# Altium schematic sheet 30_TIME_GNSS.SchDoc
size 594 x 420 mm
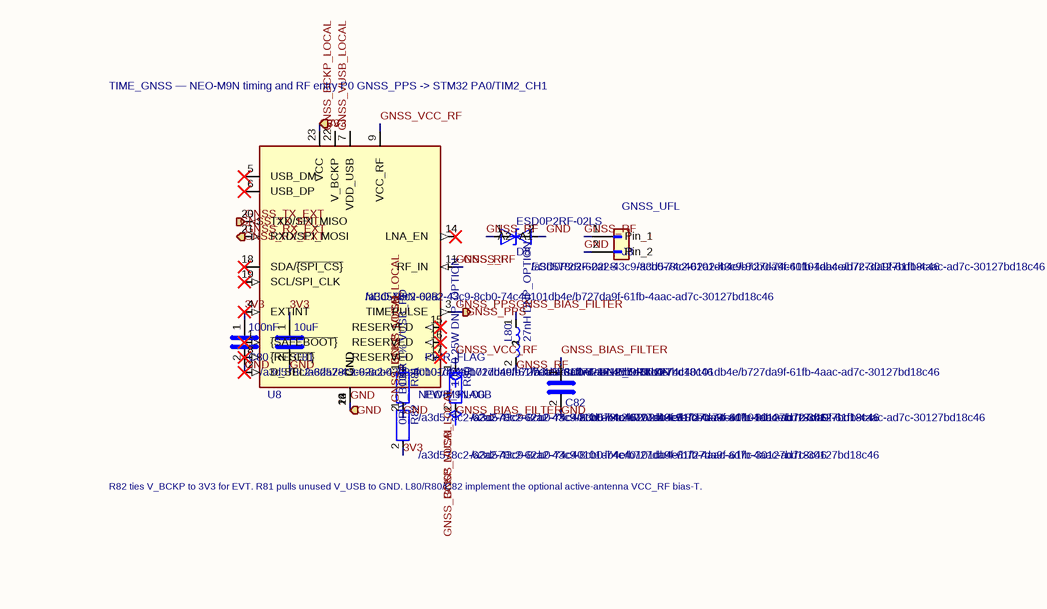
[diagram p0: 30_TIME_GNSS.SchDoc, top]
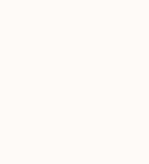
[diagram p1: 30_TIME_GNSS.SchDoc, bottom]

## Parts
#FLG0301  hierarchy_path: /a3d578c2-62a2-43c9-8cb0-74c40101db4e/b727da9f-61fb-4aac-ad7c-30127bd18c46  (hidden comment: PWR_FLAG)  (graphical)
#FLG0302  hierarchy_path: /a3d578c2-62a2-43c9-8cb0-74c40101db4e/b727da9f-61fb-4aac-ad7c-30127bd18c46  (hidden comment: PWR_FLAG)  (graphical)
C80  hierarchy_path: /a3d578c2-62a2-43c9-8cb0-74c40101db4e/b727da9f-61fb-4aac-ad7c-30127bd18c46  [C_0402_1005Metric]  (hidden comment: 100nF)
C81  hierarchy_path: /a3d578c2-62a2-43c9-8cb0-74c40101db4e/b727da9f-61fb-4aac-ad7c-30127bd18c46  [C_0805_2012Metric]  (hidden comment: 10uF)
C82  hierarchy_path: /a3d578c2-62a2-43c9-8cb0-74c40101db4e/b727da9f-61fb-4aac-ad7c-30127bd18c46  [C_0402_1005Metric]  (hidden comment: 100nF DNP_OPTION)
D8  hierarchy_path: /a3d578c2-62a2-43c9-8cb0-74c40101db4e/b727da9f-61fb-4aac-ad7c-30127bd18c46  [ESD0P2RF-02LS_PG-TSSLP-2-1]  (hidden comment: ESD0P2RF-02LS)
J8  hierarchy_path: /a3d578c2-62a2-43c9-8cb0-74c40101db4e/b727da9f-61fb-4aac-ad7c-30127bd18c46  [Hirose_UFL_R_SMT_K]  (hidden comment: GNSS_UFL)
L80  hierarchy_path: /a3d578c2-62a2-43c9-8cb0-74c40101db4e/b727da9f-61fb-4aac-ad7c-30127bd18c46  [L_0402_1005Metric]  (hidden comment: 27nH DNP_OPTION)
R80  hierarchy_path: /a3d578c2-62a2-43c9-8cb0-74c40101db4e/b727da9f-61fb-4aac-ad7c-30127bd18c46  [R_0805_2012Metric]  (hidden comment: 10R 0.25W DNP_OPTION)
R81  hierarchy_path: /a3d578c2-62a2-43c9-8cb0-74c40101db4e/b727da9f-61fb-4aac-ad7c-30127bd18c46  [R_0603_1608Metric]  (hidden comment: 100k 1% VUSB_PD)
R82  hierarchy_path: /a3d578c2-62a2-43c9-8cb0-74c40101db4e/b727da9f-61fb-4aac-ad7c-30127bd18c46  [R_0603_1608Metric]  (hidden comment: 0R V_BCKP)
U8  hierarchy_path: /a3d578c2-62a2-43c9-8cb0-74c40101db4e/b727da9f-61fb-4aac-ad7c-30127bd18c46  [NEO-M9N_LCC24_12.2x16mm]  (hidden comment: NEO-M9N-00B)

## Ports
3V3 (in), GND, GNSS_PPS (out), GNSS_RX_EXT (in), GNSS_TX_EXT (out)

## Nets
3V3: C80.1 C81.1 R82.2 U8.4(EXTINT) U8.23(VCC) ; port 3V3
GND: C80.2 C81.2 C82.2 D8.2(A2) J8.2(Pin_2) R81.2 U8.2(D_SEL) U8.10(GND) U8.12(GND) U8.13(GND) U8.24(GND) ; port GND
GNSS_BCKP_LOCAL: #FLG0301.1 R82.1 U8.22(V_BCKP)
GNSS_BIAS_FILTER: C82.1 L80.1 R80.2
GNSS_PPS: U8.3(TIMEPULSE) ; port GNSS_PPS
GNSS_RF: D8.1(A1) J8.1(Pin_1) L80.2 U8.11(RF_IN)
GNSS_RX_EXT: U8.21(RXD/SPI_MOSI) ; port GNSS_RX_EXT
GNSS_TX_EXT: U8.20(TXD/SPI_MISO) ; port GNSS_TX_EXT
GNSS_VCC_RF: R80.1 U8.9(VCC_RF)
GNSS_VUSB_LOCAL: #FLG0302.1 R81.1 U8.7(VDD_USB)

Not connected (* = marked no-connect by the designer): U8 1(~{{SAFEBOOT}})* 5(USB_DM)* 6(USB_DP)* 8(~{{RESET}})* 14(LNA_EN)* 15(RESERVED)* 16(RESERVED)* 17(RESERVED)* 18(SDA/~{{SPI_CS}})* 19(SCL/SPI_CLK)*

## Notes on the sheet
- (near U8) TIME_GNSS — NEO-M9N timing and RF entry
  P0 GNSS_PPS -> STM32 PA0/TIM2_CH1
- R82 ties V_BCKP to 3V3 for EVT. R81 pulls unused V_USB to GND.
  L80/R80/C82 implement the optional active-antenna VCC_RF bias-T.
- 1
- 2
- 3
- 4
- 5
- 6
- 7
- 8
- 9
- 10
- 11
- A
- B
- C
- D
- E
- F
- G
- H
- Title: EVT_SYS_CARRIER
- File: 30_TIME_GNSS.kicad_sch
- Sheet: /
- KiCad E.D.A.  kicad (5.1.4)-1
- Size: A2
- Date:
- Rev:
- Id: 1/1

## Library data of the parts
C80-C82 = C
  C80: Value: 100nF; Footprint: Capacitor_SMD:C_0402_1005Metric
  C81: Value: 10uF; Footprint: Capacitor_SMD:C_0805_2012Metric
  C82: Value: 100nF DNP_OPTION; Footprint: Capacitor_SMD:C_0402_1005Metric
D8 = D_TVS: MPN: ESD0P2RF-02LS; Value: ESD0P2RF-02LS; Footprint: SystemCarrier_Local:ESD0P2RF-02LS_PG-TSSLP-2-1
J8 = Conn_01x02: Value: GNSS_UFL; Footprint: SystemCarrier_Altium:Hirose_UFL_R_SMT_K
L80 = L: Value: 27nH DNP_OPTION; Footprint: Inductor_SMD:L_0402_1005Metric
R80-R82 = R
  R80: Value: 10R 0.25W DNP_OPTION; Footprint: Resistor_SMD:R_0805_2012Metric
  R81: Value: 100k 1% VUSB_PD; Footprint: Resistor_SMD:R_0603_1608Metric
  R82: Value: 0R V_BCKP; Footprint: Resistor_SMD:R_0603_1608Metric
U8 = NEO-M9N: MPN: NEO-M9N-00B; Value: NEO-M9N-00B; Footprint: SystemCarrier_Local:NEO-M9N_LCC24_12.2x16mm
#FLG0301 #FLG0302 = PWR_FLAG: Value: PWR_FLAG